# Altium schematic sheet LCD_Drive_Sec.SchDoc
size A4
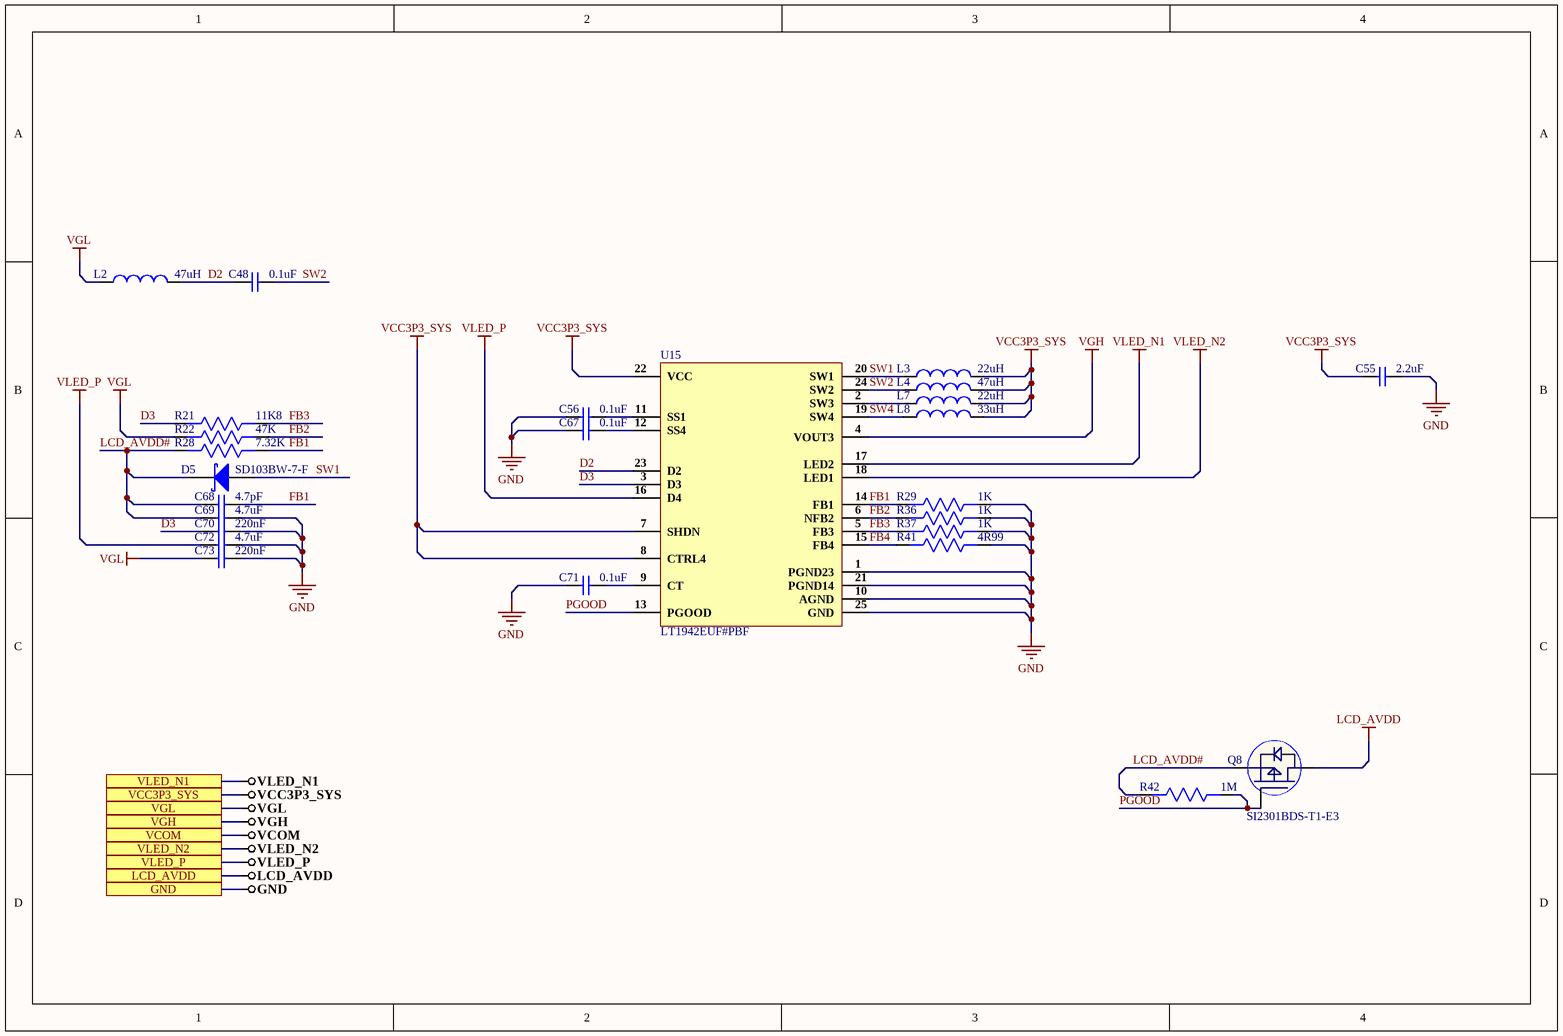
[diagram p0: LCD_Drive_Sec.SchDoc]

## Parts
C48  0.1uF  [CAP 0201]
C55  2.2uF  [Cap0402]
C56  0.1uF  [CAP 0201]
C67  0.1uF  [CAP 0201]
C68  4.7pF  [Cap0603]
C69  4.7uF  [Cap0603]
C70  220nF  [Cap0603]
C71  0.1uF  [CAP 0201]
C72  4.7uF  [Cap0603]
C73  220nF  [Cap0603]
D5  SD103BW-7-F  [SOD-123]
L2  47uH  [LQH44PN470MJ0L]
L3  22uH  [NRS6045T220MMGK]
L4  47uH  [LQH44PN470MJ0L]
L7  22uH  [NRS6045T220MMGK]
L8  33uH  [CBC3225T330KR]
Q8  SI2301BDS-T1-E3  [SI2301BDS-T1-E3]
R21  11K8  [Res0603]
R22  47K  [Res-0201]
R28  7.32K  [Res0603]
R29  1K  [Res-0201]
R36  1K  [Res-0201]
R37  1K  [Res-0201]
R41  4R99  [Res0603]
R42  1M  [Res-0201]
U15  LT1942EUF#PBF  [LT1942EUF#PBF]

## Ports
GND, LCD_AVDD, VCC3P3_SYS, VCOM, VGH, VGL, VLED_N1, VLED_N2, VLED_P

## Nets
GND: C55.2 C56.1 C67.1 C69.2 C70.2 C71.1 C72.2 C73.2 R29.1 R36.1 R37.1 R41.1 U15.1(PGND23) U15.10(AGND) U15.21(PGND14) U15.25(GND) ; port GND
LCD_AVDD: Q8.3(D) ; port LCD_AVDD
VCC3P3_SYS: C55.1 L3.2 L4.2 L7.2 L8.2 U15.7(SHDN) U15.8(CTRL4) U15.22(VCC) ; port VCC3P3_SYS
VCOM: port VCOM
VGH: U15.4(VOUT3) ; port VGH
VGL: C73.1 L2.2 R22.2 ; port VGL
VLED_N1: U15.17(LED2) ; port VLED_N1
VLED_N2: U15.18(LED1) ; port VLED_N2
VLED_P: C72.1 U15.16(D4) ; port VLED_P
D2: C48.2 L2.1 U15.23(D2)
D3: C70.1 R21.2 U15.3(D3)
FB1: C68.2 R28.1 R29.2 U15.14(FB1)
FB2: R22.1 R36.2 U15.6(NFB2)
FB3: R21.1 R37.2 U15.5(FB3)
FB4: R41.2 U15.15(FB4)
LCD_AVDD#: C68.1 C69.1 D5.1(K) Q8.2(S) R28.2 R42.2
PGOOD: Q8.1(G) R42.1 U15.13(PGOOD)
SW1: D5.2(A) L3.1 U15.20(SW1)
SW2: C48.1 L4.1 U15.24(SW2)
SW4: L8.1 U15.19(SW4)
NetC56_2: C56.2 U15.11(SS1)
NetC67_2: C67.2 U15.12(SS4)
NetC71_2: C71.2 U15.9(CT)
NetL7_1: L7.1 U15.2(SW3)

## Library data of the parts
C48 C56 C67 C71 = GRM033C81E104KE14D: CAP CER 0.1UF 25V X6S 0201; Manufacturer: Murata; Capacitance: 100nF; Tolerance: 10%; Supplier 1: Digi-Key; Manufacturer Part Number: GRM033C81E104KE14D; RoHS: Yes; Category: Ceramic Capacitors; Stock 1: 91; Pricing 1: 1=0.10000, 10=0.05100, 50=0.02780, 100=0.02260, 500=0.01616, 1000=0.01270, 2500=0.01155, 5000=0.01063 (USD); Mount: Surface Mount; Case/Package: 0201; Case Code (Metric): 0603; Case Code (Imperial): 0201; Weight: 1.2E-05oz; Min Operating Temperature: -55°C; Max Operating Temperature: 105°C; Packaging: Tape and Reel; Voltage Rating: 25V; Dielectric: X6S; Termination: SMD/SMT; Voltage Rating (DC): 25V; Package Quantity: 15000; Length: 0.024inch; Width: 0.3mm; Height: 0.3mm; Thickness: 0.013inch; RoHS Compliant: Yes; ComponentLink1URL: http://www.mouser.com/ds/2/281/c02e-2905.pdf?src-supplier=Mouser; ComponentLink1Description: http://www.mouser.com/ds/2/281/c02e-2905.pdf?src-supplier=Mouser; ComponentLink2URL: http://www.farnell.com/datasheets/2722733.pdf?src-supplier=Farnell; ComponentLink2Description: http://www.farnell.com/datasheets/2722733.pdf?src-supplier=Farnell; ComponentLink3URL: http://search.murata.co.jp/Ceramy/image/img/A01X/G101/ENG/GRM033C81E104KE14-01.pdf?src-supplier=Digi-Key; ComponentLink3Description: http://search.murata.co.jp/Ceramy/image/img/A01X/G101/ENG/GRM033C81E104KE14-01.pdf?src-supplier=Digi-Key; Supplier Part Number 1: 490-10403-1-ND
C55 = GRM155R6YA225ME11D: CAP 2.2UF 35V X5R 20% 0402; Manufacturer: Murata; Supplier 1: Digi-Key; Manufacturer Part Number: GRM155R6YA225ME11D; Stock 1: 18773; Pricing 1: 1=0.26, 10=0.176, 100=0.0998, 500=0.07044, 1000=0.06163, 2500=0.0587, 5000=0.05429 (USD); Supplier Part Number 1: 490-18213-1-ND
C68 = CC0603CRNPO9BN4R7: CAP CER 4.7PF 50V C0G/NPO 0603; Manufacturer: Yageo; Dielectric Material: Ceramic; Dielectric: C0G; Temperature Coefficient: 30ppm/°C; Insulation Resistance: 100GR; Supplier 1: Digi-Key; Manufacturer Part Number: CC0603CRNPO9BN4R7; RoHS: Yes; Category: Ceramic Capacitors; Stock 1: 466; Pricing 1: 1=0.10000, 10=0.05800, 50=0.03180, 100=0.02600, 500=0.01856, 1000=0.01458 (USD); Mount: Surface Mount; Case/Package: 0603; Case Code (Imperial): 0603; Case Code (Metric): 1608; Weight: 7.1E-05oz; Min Operating Temperature: -55°C; Max Operating Temperature: 125°C; Capacitance: 4.7pF; Voltage Rating: 50V; Voltage Rating (DC): 50V; Packaging: Tape and Reel; Termination: SMD/SMT; Resistor Type: Ceramic; Voltage: 50V; Series: CC; Length: 1.6mm; Width: 0.031inch; Height: 0.8mm; Thickness: 0.035inch; Depth: 0.8mm; Radiation Hardening: No; REACH SVHC: Unknown; Lead Free: Lead Free; ComponentLink1URL: https://datasheet.ciiva.com/11788/0900766b8079c870-11788389.pdf?src-supplier=RSComponents; ComponentLink1Description: https://datasheet.ciiva.com/11788/0900766b8079c870-11788389.pdf?src-supplier=RSComponents; ComponentLink2URL: https://datasheet.ciiva.com/26862/getdatasheetpartid-373392-26862694.pdf?src-supplier=Verical; ComponentLink2Description: https://datasheet.ciiva.com/26862/getdatasheetpartid-373392-26862694.pdf?src-supplier=Verical; ComponentLink3URL: https://datasheet.ciiva.com/5427/upy-gp-np0-16v-to-50v-8-3714-5427717.pdf?src-supplier=Mouser; ComponentLink3Description: https://datasheet.ciiva.com/5427/upy-gp-np0-16v-to-50v-8-3714-5427717.pdf?src-supplier=Mouser; ComponentLink4URL: https://datasheet.ciiva.com/8033/1443161-8033694.pdf?src-supplier=Element14; ComponentLink4Description: https://datasheet.ciiva.com/8033/1443161-8033694.pdf?src-supplier=Element14; ComponentLink5URL: https://datasheet.ciiva.com/8033/1443161-8033692.pdf?src-supplier=Element14; ComponentLink5Description: https://datasheet.ciiva.com/8033/1443161-8033692.pdf?src-supplier=Element14; Supplier Part Number 1: 311-1740-1-ND
C69 C72 = C1608X5R1E475M080AC: CAP CER 4.7UF 25V X5R 0603; Manufacturer: TDK; Dielectric Material: Ceramic; Tolerance: 20%; ComponentLink1URL: http://www.yageo.com/NewPortal/_en/search/productDocs.jsp?YageoPartNumber=AC0603JRNPO0BN470&src-supplier=Digi-Key; ComponentLink1Description: http://www.yageo.com/NewPortal/_en/search/productDocs.jsp?YageoPartNumber=AC0603JRNPO0BN470&src-supplier=Digi-Key; Supplier 1: Mouser; Manufacturer Part Number: C1608X5R1E475M080AC; Stock 1: 40236; Pricing 1: 1=0.29, 10=0.237, 100=0.142, 500=0.106, 1000=0.09, 4000=0.076, 8000=0.072, 24000=0.07, 48000=0.067 (USD); Mount: Surface Mount; Case/Package: 0603; Weight: 7.1E-05oz; Case Code (Metric): 1608; Case Code (Imperial): 0603; Min Operating Temperature: -55°C; Max Operating Temperature: 85°C; Voltage Rating (DC): 25V; Packaging: Tape and Reel; Package Quantity: 1; Capacitance: 4.7uF; Voltage Rating: 25V; Dielectric: X5R; Termination: SMD/SMT; Composition: Ceramic; Length: 1.6mm; Height: 0.8mm; Width: 0.031inch; Thickness: 0.039inch; Depth: 0.8mm; Radiation Hardening: No; REACH SVHC: No SVHC; Lead Free: Lead Free; ComponentLink2URL: https://www.verical.com/server-webapp/html/getDatasheet?partID=726745&src-supplier=Verical; ComponentLink2Description: https://www.verical.com/server-webapp/html/getDatasheet?partID=726745&src-supplier=Verical; Supplier Part Number 1: 810-C1608X5R1E475M
C70 C73 = GRM188R11E224KA88D: CAP CER0.22uF 25V R 10%  0603; Manufacturer: Murata; Supplier 1: RSComponents; Manufacturer Part Number: GRM188R11E224KA88D; RoHS: Yes; Category: Ceramic Capacitors; Stock 1: 72; Pricing 1: 1000=0.02100, 2000=0.01900, 4000=0.01800, 8000=0.01800 (GBP); Case/Package: Ceramic; Min Operating Temperature: -55°C; Max Operating Temperature: 125°C; Capacitance: 220nF; Tolerance: 10%; Voltage Rating (DC): 25V; Length: 1.6mm; Width: 0.8mm; Height: 0.8mm; Thickness: 800um; Lead Free: Lead Free; RoHS Compliant: Yes; Supplier Part Number 1: 7980348P
D5 = SD103BW-7-F: Diode Schottky 30V 0.35A 2-Pin SOD-123 T/R; Manufacturer: Diodes; Forward Current: 350mA; Peak Non-Repetitive Surge Current: 1.5A; Element Configuration: Single; Forward Voltage: 600mV; Max Power Dissipation: 400mW; Reverse Recovery Time: 10ns; Max Reverse Current: 5uA; Supplier 1: Digi-Key; Manufacturer Part Number: SD103BW-7-F; RoHS: Yes; Category: Rectifier Diodes; Stock 1: 2033; Pricing 1: 1=0.44000, 10=0.32400, 100=0.18340, 500=0.12144, 1000=0.09310 (USD); Mount: Surface Mount; Number of Pins: 2; Weight: 0.000353oz; Min Operating Temperature: -65°C; Max Operating Temperature: 125°C; Max Repetitive Reverse Voltage (Vrrm): 30V; Package Quantity: 3000; Packaging: Tape and Reel; Average Rectified Current: 350mA; Power Dissipation: 400mW; Max Forward Surge Current (Ifsm): 1.5A; Termination: SMD/SMT; Power Rating: 400mW; Max Reverse Voltage (DC): 30V; Series: -; Length: 2.85mm; Width: 1.7mm; Height: 1.25mm; Radiation Hardening: No; REACH SVHC: No SVHC; Lead Free: Lead Free; RoHS Compliant: Yes; ComponentLink1URL: https://datasheet.ciiva.com/36526/1541925-36526008.pdf?src-supplier=Jameco; ComponentLink1Description: https://datasheet.ciiva.com/36526/1541925-36526008.pdf?src-supplier=Jameco; ComponentLink2URL: https://datasheet.ciiva.com/912/ds11013-912934.pdf?src-supplier=Digi-Key; ComponentLink2Description: https://datasheet.ciiva.com/912/ds11013-912934.pdf?src-supplier=Digi-Key; ComponentLink3URL: https://datasheet.ciiva.com/912/ds11013-912935.pdf?src-supplier=Digi-Key; ComponentLink3Description: https://datasheet.ciiva.com/912/ds11013-912935.pdf?src-supplier=Digi-Key; ComponentLink4URL: https://datasheet.ciiva.com/16574/ds11013-16574365.pdf?src-supplier=Avnet+Europe; ComponentLink4Description: https://datasheet.ciiva.com/16574/ds11013-16574365.pdf?src-supplier=Avnet+Europe; ComponentLink5URL: https://datasheet.ciiva.com/22695/480042-22695847.pdf?src-supplier=Element14; ComponentLink5Description: https://datasheet.ciiva.com/22695/480042-22695847.pdf?src-supplier=Element14; ComponentLink6URL: https://datasheet.ciiva.com/7964/ds11013-7964329.pdf?src-supplier=Element14; ComponentLink6Description: https://datasheet.ciiva.com/7964/ds11013-7964329.pdf?src-supplier=Element14; Supplier Part Number 1: SD103BW-7-FDICT-ND
L2 L4 = LQH44PN470MJ0L: 1515 Inductors (SMD) ROHS; Manufacturer: Murata Electronics; Tolerance: ±20%; Rated Current: 300mA; DC Resistance (DCR): 1.014Ω; Package: 1515; Inductance: 47uH
L3 L7 = NRS6045T220MMGK: IND SMD 22uH 1.6A 20%, T&R; Manufacturer: Taiyo Yuden; Core Material: Ferrite; Self Resonant Frequency: 7MHz; DC Resistance (DCR): 139.1mR; Max DC Current: 2A; Shielding: Shielded; Test Frequency: 100kHz; Supplier 1: Digi-Key; Manufacturer Part Number: NRS6045T220MMGK; RoHS: Yes; Category: Fixed Inductors; Stock 1: 13300; Pricing 1: 1=0.41000, 10=0.36500, 25=0.31920, 50=0.27360, 100=0.25080, 250=0.22796, 500=0.21430 (USD); Mount: Surface Mount; Case/Package: Nonstandard; Number of Pins: 2; Min Operating Temperature: -25°C; Max Operating Temperature: 125°C; Inductance: 22uH; Tolerance: 20%; Package Quantity: 1500; Current Rating: 1.6A; Saturation Current: 2A; Packaging: Tape and Reel; Resistor Type: Wirewound; Termination: SMD/SMT; Inductance Tolerance: 20%; RMS Current (Irms): 1.6A; Series: NRS; Length: 6mm; Width: 0.236inch; Height: 4.5mm; Height - Seated (Max): 0.177inch; Depth: 6.2mm; Lead Pitch: 4.7mm; Radiation Hardening: No; Halogen Free: Halogen Free; REACH SVHC: Unknown; Lead Free: Lead Free; RoHS Compliant: Yes; ComponentLink1URL: https://datasheet.ciiva.com/25607/0900766b810b3cd2-25607073.pdf?src-supplier=RSComponents; ComponentLink1Description: https://datasheet.ciiva.com/25607/0900766b810b3cd2-25607073.pdf?src-supplier=RSComponents; ComponentLink2URL: https://datasheet.ciiva.com/1044/nrs6045t220mmgk-ss-1044019.pdf?src-supplier=Digi-Key; ComponentLink2Description: https://datasheet.ciiva.com/1044/nrs6045t220mmgk-ss-1044019.pdf?src-supplier=Digi-Key; ComponentLink3URL: https://datasheet.ciiva.com/8500/nrs6045t220mmgk-ss-8500556.pdf?src-supplier=Avnet; ComponentLink3Description: https://datasheet.ciiva.com/8500/nrs6045t220mmgk-ss-8500556.pdf?src-supplier=Avnet; ComponentLink4URL: https://datasheet.ciiva.com/4958/wound04-e-4958152.pdf?src-supplier=Mouser; ComponentLink4Description: https://datasheet.ciiva.com/4958/wound04-e-4958152.pdf?src-supplier=Mouser; ComponentLink5URL: https://datasheet.ciiva.com/22710/1909430-22710364.pdf?src-supplier=Element14; ComponentLink5Description: https://datasheet.ciiva.com/22710/1909430-22710364.pdf?src-supplier=Element14; Supplier Part Number 1: 587-2952-1-ND
L8 = CBC3225T330KR: IND SMD 33 H 20% 500mA Idc; Manufacturer: Taiyo Yuden; Core Material: Ferrite; Self Resonant Frequency: 13MHz; Current Rating: 570mA; Tolerance: 10%; Shielding: Unshielded; DC Resistance (DCR): 533mR; Test Frequency: 100kHz; Supplier 1: Digi-Key; Manufacturer Part Number: CBC3225T330KR; RoHS: Yes; Category: Fixed Inductors; Stock 1: 821; Pricing 1: 1=0.30000, 10=0.26800, 25=0.23480, 50=0.20120, 100=0.18450, 250=0.16776, 500=0.15768 (USD); Mount: Surface Mount; Case/Package: 1210; Case Code (Metric): 3225; Case Code (Imperial): 1210; Min Operating Temperature: -40°C; Max Operating Temperature: 105°C; Saturation Current: 500mA; Packaging: Tape and Reel; Inductance: 33uH; Resistor Type: Wirewound; Inductance Tolerance: 10%; Package Quantity: 1000; Max DC Current: 570mA; Termination: SMD/SMT; DC Current: 570mA; Series: CBC; Length: 3.2mm; Width: 0.098inch; Height: 2.5mm; Height - Seated (Max): 0.106inch; Depth: 2.7mm; Radiation Hardening: No; RoHS Compliant: Yes; REACH SVHC: Unknown; Military Standard: Not; Lead Free: Lead Free; Halogen Free: Halogen Free; ComponentLink1URL: https://datasheet.ciiva.com/6701/cbc3225t330kr-ss-6701095.pdf?src-supplier=Digi-Key; ComponentLink1Description: https://datasheet.ciiva.com/6701/cbc3225t330kr-ss-6701095.pdf?src-supplier=Digi-Key; ComponentLink2URL: https://datasheet.ciiva.com/26871/getdatasheetpartid-639195-26871179.pdf?src-supplier=Verical; ComponentLink2Description: https://datasheet.ciiva.com/26871/getdatasheetpartid-639195-26871179.pdf?src-supplier=Verical; ComponentLink3URL: https://datasheet.ciiva.com/25607/0900766b810b3b0a-25607935.pdf?src-supplier=RSComponents; ComponentLink3Description: https://datasheet.ciiva.com/25607/0900766b810b3b0a-25607935.pdf?src-supplier=RSComponents; Supplier Part Number 1: 587-3068-1-ND
Q8 = SI2301BDS-T1-E3: MOSFET 20V 2.0A 0.9W; Manufacturer: Vishay; Manufacturer Part Number: SI2301BDST1E3; Nominal Vgs: -950mV; Rds On Max: 100mR; Input Capacitance: 375pF; Rise Time: 40ns; Number of Elements: 1; Max Power Dissipation: 900mW; Continuous Drain Current (ID): 2.4A; Gate to Source Voltage (Vgs): 4.5V; Fall Time: 20ns; Turn-Off Delay Time: 30ns; Power Dissipation: 700mW; Element Configuration: Single; Drain to Source Breakdown Voltage: -20V; Polarity: P-CHANNEL; Supplier 1: Digi-Key; RoHS: Yes; Category: MOSFETs; Stock 1: 51394; Pricing 1: 1=0.42000, 10=0.34100, 100=0.23230, 500=0.17424, 1000=0.13068 (USD); Mount: Surface Mount; Case/Package: SOT-23-3; Number of Pins: 3; Weight: 0.000282oz; Contact Plating: Tin,Matte; Min Operating Temperature: -55°C; Max Operating Temperature: 150°C; Package Quantity: 3000; Packaging: Cut Tape; Drain to Source Voltage (Vdss): 20V; Drain to Source Resistance: 100mR; Threshold Voltage: -950mV; Turn-On Delay Time: 20ns; Number of Channels: 1; On-State Resistance: 100MR; Series: SI2; Length: 2.9mm; Width: 1.6mm; Height: 1.45mm; Radiation Hardening: No; REACH SVHC: Unknown; Lead Free: Lead Free; ComponentLink1URL: https://datasheet.ciiva.com/7789/110460-7789013.pdf?src-supplier=Element14; ComponentLink1Description: https://datasheet.ciiva.com/7789/110460-7789013.pdf?src-supplier=Element14; ComponentLink2URL: https://datasheet.ciiva.com/34303/1926622-34303264.pdf?src-supplier=Jameco; ComponentLink2Description: https://datasheet.ciiva.com/34303/1926622-34303264.pdf?src-supplier=Jameco; ComponentLink3URL: https://datasheet.ciiva.com/28603/1763316-28603469.pdf?src-supplier=Element14; ComponentLink3Description: https://datasheet.ciiva.com/28603/1763316-28603469.pdf?src-supplier=Element14; ComponentLink4URL: https://datasheet.ciiva.com/16199/si2301bds-t1-e3-16199268.pdf?src-supplier=Future+Electronics; ComponentLink4Description: https://datasheet.ciiva.com/16199/si2301bds-t1-e3-16199268.pdf?src-supplier=Future+Electronics; ComponentLink5URL: https://datasheet.ciiva.com/26790/si2301bds-t1-e3-26790619.pdf?src-supplier=IIIC; ComponentLink5Description: https://datasheet.ciiva.com/26790/si2301bds-t1-e3-26790619.pdf?src-supplier=IIIC; ComponentLink6URL: https://datasheet.ciiva.com/18433/70026063-18433994.pdf?src-supplier=Allied+Electronics; ComponentLink6Description: https://datasheet.ciiva.com/18433/70026063-18433994.pdf?src-supplier=Allied+Electronics; ComponentLink7URL: https://datasheet.ciiva.com/11161/si2301bds-11161447.pdf?src-supplier=Avnet; ComponentLink7Description: https://datasheet.ciiva.com/11161/si2301bds-11161447.pdf?src-supplier=Avnet; ComponentLink8URL: https://datasheet.ciiva.com/26139/si2301bds-26139129.pdf?src-supplier=Avnet+Europe; ComponentLink8Description: https://datasheet.ciiva.com/26139/si2301bds-26139129.pdf?src-supplier=Avnet+Europe; ComponentLink9URL: https://datasheet.ciiva.com/6367/si2301bds-6367030.pdf?src-supplier=Digi-Key; ComponentLink9Description: https://datasheet.ciiva.com/6367/si2301bds-6367030.pdf?src-supplier=Digi-Key; ComponentLink10URL: https://datasheet.ciiva.com/6367/si2301bds-6367033.pdf?src-supplier=Digi-Key; ComponentLink10Description: https://datasheet.ciiva.com/6367/si2301bds-6367033.pdf?src-supplier=Digi-Key; Supplier Part Number 1: SI2301BDS-T1-E3CT-ND
R21 = AC0603FR-0711K8L: Res SMD 11.8K Ohm 1% 1/10W 0603; Manufacturer: Yageo; Resistance: 11.8kR; Max Power Dissipation: 100mW; Temperature Coefficient: 100ppm/°C; Supplier 1: Avnet; Manufacturer Part Number: AC0603FR-0711K8L; RoHS: Yes; Category: Chip SMD Resistors; Pricing 1: 5000=0.00176, 10000=0.00174, 20000=0.00169, 30000=0.00165, 40000=0.00159, 50000=0.00155, 500000=0.00151 (USD); Case/Package: 0603; Min Operating Temperature: -55°C; Max Operating Temperature: 155°C; Packaging: Tape and Reel; Resistor Type: Thick Film; Number of Terminations: 2; Tolerance: 1%; Features: Moisture Resistant,Automotive AEC-Q200; Length: 0.063inch; Width: 0.031inch; Height: 0.022inch; RoHS Compliant: Yes; ComponentLink1URL: http://www.yageo.com/NewPortal/yageodocoutput?fileName=/pdf/R-Chip/PYu-AC_51_RoHS_L_6.pdf&src-supplier=Digi-Key; ComponentLink1Description: http://www.yageo.com/NewPortal/yageodocoutput?fileName=/pdf/R-Chip/PYu-AC_51_RoHS_L_6.pdf&src-supplier=Digi-Key; Supplier Part Number 1: AC0603FR-0711K8L
R22 = RC0201JR-0747KL: RES SMD 47K OHM 5% 1/20W 0201; Manufacturer: Yageo; Resistance: 47kR; Temperature Coefficient: 200ppm/°C; Voltage Rating: 25V; Power Rating: 50mW; Supplier 1: Digi-Key; Manufacturer Part Number: RC0201JR-0747KL; RoHS: Yes; Category: Chip SMD Resistors; Stock 1: 472205; Pricing 1: 1=0.10000, 10=0.02800, 100=0.01140, 1000=0.00513, 2500=0.00445, 5000=0.00368 (USD); Case/Package: 0201; Number of Pins: 2; Contact Plating: Tin,Matte; Case Code (Metric): 0603; Case Code (Imperial): 0201; Min Operating Temperature: -55°C; Max Operating Temperature: 125°C; Tolerance: 5%; Resistor Type: Thick Film; Package Quantity: 10000; Packaging: Tape and Reel; Number of Terminations: 2; Termination: SMD/SMT; Max Power Dissipation: 50mW; Voltage Rating (DC): 25V; Working Voltage: 25V; Features: Moisture Resistant; Series: RC; Resistance Tolerance: 5%; Construction: Rectangular; Technology: THICK FILM; Length: 0.6mm; Width: 0.3mm; Height: 0.01inch; Depth: 0.3mm; Radiation Hardening: No; REACH SVHC: No SVHC; Military Standard: Not; Lead Free: Lead Free; RoHS Compliant: Yes; ComponentLink1URL: https://datasheet.ciiva.com/2492/pyu-r-int-thick-7-2492966.pdf?src-supplier=Digi-Key; ComponentLink1Description: https://datasheet.ciiva.com/2492/pyu-r-int-thick-7-2492966.pdf?src-supplier=Digi-Key; ComponentLink2URL: https://datasheet.ciiva.com/5989/1563626-5989624.pdf?src-supplier=Farnell; ComponentLink2Description: https://datasheet.ciiva.com/5989/1563626-5989624.pdf?src-supplier=Farnell; ComponentLink3URL: https://datasheet.ciiva.com/28399/pyu-rc0201-51-rohs-l-8-28399338.pdf?src-supplier=Avnet+Europe; ComponentLink3Description: https://datasheet.ciiva.com/28399/pyu-rc0201-51-rohs-l-8-28399338.pdf?src-supplier=Avnet+Europe; ComponentLink4URL: https://datasheet.ciiva.com/8889/pyu-rc0201-51-rohs-l-8-8889071.pdf?src-supplier=Avnet; ComponentLink4Description: https://datasheet.ciiva.com/8889/pyu-rc0201-51-rohs-l-8-8889071.pdf?src-supplier=Avnet; ComponentLink5URL: https://datasheet.ciiva.com/2492/pyu-r-int-thick-7-2492965.pdf?src-supplier=Digi-Key; ComponentLink5Description: https://datasheet.ciiva.com/2492/pyu-r-int-thick-7-2492965.pdf?src-supplier=Digi-Key; ComponentLink6URL: https://datasheet.ciiva.com/2492/pyu-r-int-thick-7-2492967.pdf?src-supplier=Digi-Key; ComponentLink6Description: https://datasheet.ciiva.com/2492/pyu-r-int-thick-7-2492967.pdf?src-supplier=Digi-Key; ComponentLink7URL: https://datasheet.ciiva.com/16855/pyu-rc0201-51-rohs-l-8-16855517.pdf?src-supplier=Avnet+Europe; ComponentLink7Description: https://datasheet.ciiva.com/16855/pyu-rc0201-51-rohs-l-8-16855517.pdf?src-supplier=Avnet+Europe; Supplier Part Number 1: 311-47KNCT-ND
R28 = ERJ3EKF7321V: PANASONIC - ERJ3EKF7321V - RES, 7K32, 1%, 0.1W, 0603, THICK FILM; Manufacturer Part Number: ERJ-3EKF7321V; Resistance: 7.32kR; Power Rating: 100mW; Voltage Rating: 75V; Temperature Coefficient: 100ppm/°C; Voltage Rating (DC): 50V; Supplier 1: Digi-Key; Manufacturer: Panasonic; RoHS: Yes; Category: Chip SMD Resistors; Stock 1: 29175; Pricing 1: 1=0.10000, 10=0.03700, 100=0.01490, 1000=0.00670, 2500=0.00582 (USD); Mount: Surface Mount; Case/Package: 0603; Case Code (Imperial): 0603; Case Code (Metric): 1608; Contact Plating: Tin; Min Operating Temperature: -55°C; Max Operating Temperature: 155°C; Tolerance: 1%; Packaging: Tape and Reel; Package Quantity: 1; Resistor Type: Thick Film; Number of Terminations: 2; Termination: SMD/SMT; Max Power Dissipation: 100mW; Features: Automotive AEC-Q200; Series: ERJ; Construction: Rectangular; Resistance Tolerance: 1%; Length: 1.6mm; Width: 0.8mm; Height: 0.022inch; Depth: 0.8mm; REACH SVHC: Yes; Military Standard: Not; Lead Free: Lead Free; RoHS Compliant: Yes; ComponentLink1URL: https://datasheet.ciiva.com/9194/aoa0000ce2-9194774.pdf?src-supplier=Avnet; ComponentLink1Description: https://datasheet.ciiva.com/9194/aoa0000ce2-9194774.pdf?src-supplier=Avnet; ComponentLink2URL: https://datasheet.ciiva.com/46444/1678782-46444026.pdf?src-supplier=Element14; ComponentLink2Description: https://datasheet.ciiva.com/46444/1678782-46444026.pdf?src-supplier=Element14; ComponentLink3URL: https://datasheet.ciiva.com/16762/70260748-16762539.pdf?src-supplier=Allied+Electronics; ComponentLink3Description: https://datasheet.ciiva.com/16762/70260748-16762539.pdf?src-supplier=Allied+Electronics; ComponentLink4URL: https://datasheet.ciiva.com/7829/1678782-7829324.pdf?src-supplier=Element14; ComponentLink4Description: https://datasheet.ciiva.com/7829/1678782-7829324.pdf?src-supplier=Element14; ComponentLink5URL: https://datasheet.ciiva.com/22681/1678782-22681324.pdf?src-supplier=Element14; ComponentLink5Description: https://datasheet.ciiva.com/22681/1678782-22681324.pdf?src-supplier=Element14; ComponentLink6URL: https://datasheet.ciiva.com/30232/aoa0000ce2-30232076.pdf?src-supplier=Onlinecomponents.com; ComponentLink6Description: https://datasheet.ciiva.com/30232/aoa0000ce2-30232076.pdf?src-supplier=Onlinecomponents.com; ComponentLink7URL: https://datasheet.ciiva.com/16778/70260748-16778589.pdf?src-supplier=Allied+Electronics; ComponentLink7Description: https://datasheet.ciiva.com/16778/70260748-16778589.pdf?src-supplier=Allied+Electronics; Supplier Part Number 1: P7.32KHCT-ND
R29 R36 R37 = RC0201FR-071KL: RES SMD 1K OHM 1% 1/20W 0201; Manufacturer: Yageo; Resistance: 1kR; Temperature Coefficient: 200ppm/°C; Power Rating: 50mW; Voltage Rating: 25V; Supplier 1: Digi-Key; Manufacturer Part Number: RC0201FR-071KL; Stock 1: 3437969; Pricing 1: 1=0.1, 10=0.04, 100=0.0165, 1000=0.00739, 2500=0.00642, 5000=0.0053 (USD); Case/Package: 0201; Contact Plating: Tin,Matte; Case Code (Metric): 0603; Case Code (Imperial): 0201; Min Operating Temperature: -55°C; Max Operating Temperature: 125°C; Tolerance: 1%; Composition: Thick Film; Package Quantity: 10000; Packaging: Tape and Reel; Number of Terminations: 2; Termination: SMD/SMT; Military Standard: Not; Max Power Dissipation: 50mW; Working Voltage: 25V; Features: Moisture Resistant; Length: 0.024inch; Height: 0.01inch; Width: 0.012inch; Depth: 0.3mm; Radiation Hardening: No; REACH SVHC: Unknown; Lead Free: Lead Free; ComponentLink1URL: http://www.yageo.com/documents/recent/PYu-RC0201_51_RoHS_L_8.pdf?src-supplier=Avnet+Europe; ComponentLink1Description: http://www.yageo.com/documents/recent/PYu-RC0201_51_RoHS_L_8.pdf?src-supplier=Avnet+Europe; ComponentLink2URL: http://www.farnell.com/datasheets/2167052.pdf?src-supplier=Element14; ComponentLink2Description: http://www.farnell.com/datasheets/2167052.pdf?src-supplier=Element14; ComponentLink3URL: http://www.yageo.com/documents/recent/PYu-RC_Group_51_RoHS_L_10.pdf?src-supplier=Digi-Key; ComponentLink3Description: http://www.yageo.com/documents/recent/PYu-RC_Group_51_RoHS_L_10.pdf?src-supplier=Digi-Key; ComponentLink4URL: http://www.yageo.com/documents/recent/PYu-RC0201_51_RoHS_L_8.pdf?src-supplier=Avnet; ComponentLink4Description: http://www.yageo.com/documents/recent/PYu-RC0201_51_RoHS_L_8.pdf?src-supplier=Avnet; Supplier Part Number 1: 311-1KMCT-ND
R41 = RK73H1JTTD4R99F: Res Thick Film 0603 4.99 Ohm 1% 0.1W(1/10W) ±200ppm/C Molded SMD Automotive Punched Paper T/R; Manufacturer: KOA Speer; Manufacturer Series: RK73H; Resistance: 4.99R; Power Rating: 100mW; Voltage Rating: 50V; Temperature Coefficient: 100ppm/°C; Supplier 1: Digi-Key; Manufacturer Part Number: RK73H1JTTD4R99F; RoHS: Yes; Category: Chip SMD Resistors; Stock 1: 5000; Pricing 1: 1=0.10000, 10=0.02300, 100=0.00950, 1000=0.00427, 2500=0.00370 (USD); Case/Package: 0603; Case Code (Imperial): 0603; Case Code (Metric): 1608; Package Shape: Rectangular; Size Code: 0603; Terminal Finish: Tin; Min Operating Temperature: -55°C; Max Operating Temperature: 155°C; Tolerance: 1%; Packaging: Tape and Reel; Package Quantity: 5000; Resistor Type: Thick Film; Termination: SMD/SMT; Working Voltage: 50V; Voltage Rating (DC): 50V; Series: RK73H; Construction: Rectangular; Technology: METAL GLAZE/THICK FILM; Length: 1.6mm; Width: 0.8mm; Height: 0.45mm; Depth: 0.8mm; Military Standard: Not; RoHS Compliant: Yes; ComponentLink1URL: http://www.mouser.com/ds/2/219/RK73H-5715.pdf?src-supplier=Mouser; ComponentLink1Description: http://www.mouser.com/ds/2/219/RK73H-5715.pdf?src-supplier=Mouser; ComponentLink2URL: http://www.jameco.com/Jameco/Products/ProdDS/1887408.pdf?src-supplier=Jameco; ComponentLink2Description: http://www.jameco.com/Jameco/Products/ProdDS/1887408.pdf?src-supplier=Jameco; ComponentLink3URL: http://components.arrow.com/part/dataview/39722201S6979004N5146?src-supplier=Arrow+Electronics; ComponentLink3Description: http://components.arrow.com/part/dataview/39722201S6979004N5146?src-supplier=Arrow+Electronics; Supplier Part Number 1: 2019-RK73H1JTTD4R99FCT-ND
R42 = RC0201FR-071ML: RES SMD 1M OHM 1% 1/20W 0201; Manufacturer: Yageo; Resistance: 1MR; Temperature Coefficient: 200ppm/°C; Power Rating: 50mW; Voltage Rating: 25V; Supplier 1: Digi-Key; Manufacturer Part Number: RC0201FR-071ML; Stock 1: 3125521; Pricing 1: 1=0.1, 10=0.04, 100=0.0165, 1000=0.00739, 2500=0.00642, 5000=0.0053 (USD); Case/Package: 0201; Contact Plating: Tin,Matte; Case Code (Imperial): 0201; Case Code (Metric): 0603; Min Operating Temperature: -55°C; Max Operating Temperature: 125°C; Tolerance: 1%; Composition: Thick Film; Packaging: Tape and Reel; Package Quantity: 10000; Termination: SMD/SMT; Number of Terminations: 2; Military Standard: Not; Max Power Dissipation: 50mW; Features: Moisture Resistant; Length: 0.6mm; Height: 0.01inch; Width: 0.3mm; Depth: 0.3mm; Radiation Hardening: No; REACH SVHC: Unknown; Lead Free: Lead Free; ComponentLink1URL: http://www.farnell.com/datasheets/2167052.pdf?src-supplier=Element14; ComponentLink1Description: http://www.farnell.com/datasheets/2167052.pdf?src-supplier=Element14; ComponentLink2URL: http://www.yageo.com/documents/recent/PYu-RC_Group_51_RoHS_L_10.pdf?src-supplier=Digi-Key; ComponentLink2Description: http://www.yageo.com/documents/recent/PYu-RC_Group_51_RoHS_L_10.pdf?src-supplier=Digi-Key; ComponentLink3URL: http://www.yageo.com/documents/recent/PYu-RC_Group_51_RoHS_L_9.pdf?src-supplier=Digi-Key; ComponentLink3Description: http://www.yageo.com/documents/recent/PYu-RC_Group_51_RoHS_L_9.pdf?src-supplier=Digi-Key; Supplier Part Number 1: 311-1MMCT-ND
U15 = LT1942EUF#PBF: IC REG SW QUAD TFT LCD 24-QFN; Manufacturer: Analog Devices / Linear Technology; Min Input Voltage: 2.6V; Max Output Current: 4A; Max Input Voltage: 16V; Number of Outputs: 4; Output Voltage: 36V; Output Current: 750mA; Frequency: 1.2MHz; Min Output Voltage: 1.25V; Max Output Voltage: 1.2V; Output Type: Adjustable; Supplier 1: Digi-Key; Manufacturer Part Number: LT1942EUF#PBF; RoHS: Yes; Category: Voltage Regulators - Switching; Stock 1: 235; Pricing 1: 1=6.58000, 10=5.94800, 25=5.67160, 100=4.92450, 250=4.70320, 500=4.30650 (USD); Mount: Surface Mount; Case/Package: QFN; Number of Pins: 24; Min Operating Temperature: -40°C; Max Operating Temperature: 85°C; Max Supply Voltage: 16V; Min Supply Voltage: 2.6V; Package Quantity: 91; Packaging: Rail/Tube; Termination: SMD/SMT; Switching Frequency: 1.2MHz; Series: -; Length: 4mm; Width: 4mm; Height: 0.7mm; REACH SVHC: No SVHC; Lead Free: Lead Free; RoHS Compliant: Yes; ComponentLink1URL: https://datasheet.ciiva.com/4118/41364810s7494468n7433-4118973.pdf?src-supplier=Arrow+Electronics; ComponentLink1Description: https://datasheet.ciiva.com/4118/41364810s7494468n7433-4118973.pdf?src-supplier=Arrow+Electronics; ComponentLink2URL: https://datasheet.ciiva.com/25627/0900766b810ed99d-25627392.pdf?src-supplier=RSComponents; ComponentLink2Description: https://datasheet.ciiva.com/25627/0900766b810ed99d-25627392.pdf?src-supplier=RSComponents; ComponentLink3URL: https://datasheet.ciiva.com/6188/1717046-6188033.pdf?src-supplier=Farnell; ComponentLink3Description: https://datasheet.ciiva.com/6188/1717046-6188033.pdf?src-supplier=Farnell; ComponentLink4URL: https://datasheet.ciiva.com/26910/lt1942euf-pbf-26910561.pdf?src-supplier=IIIC; ComponentLink4Description: https://datasheet.ciiva.com/26910/lt1942euf-pbf-26910561.pdf?src-supplier=IIIC; ComponentLink5URL: https://datasheet.ciiva.com/22651/1717046-22651735.pdf?src-supplier=Element14; ComponentLink5Description: https://datasheet.ciiva.com/22651/1717046-22651735.pdf?src-supplier=Element14; ComponentLink6URL: https://datasheet.ciiva.com/7312/1717046-7312028.pdf?src-supplier=Newark; ComponentLink6Description: https://datasheet.ciiva.com/7312/1717046-7312028.pdf?src-supplier=Newark; Supplier Part Number 1: LT1942EUF#PBF-ND